# EasyEDA Pro project Macropad V1.epro

# Schematic keyboard
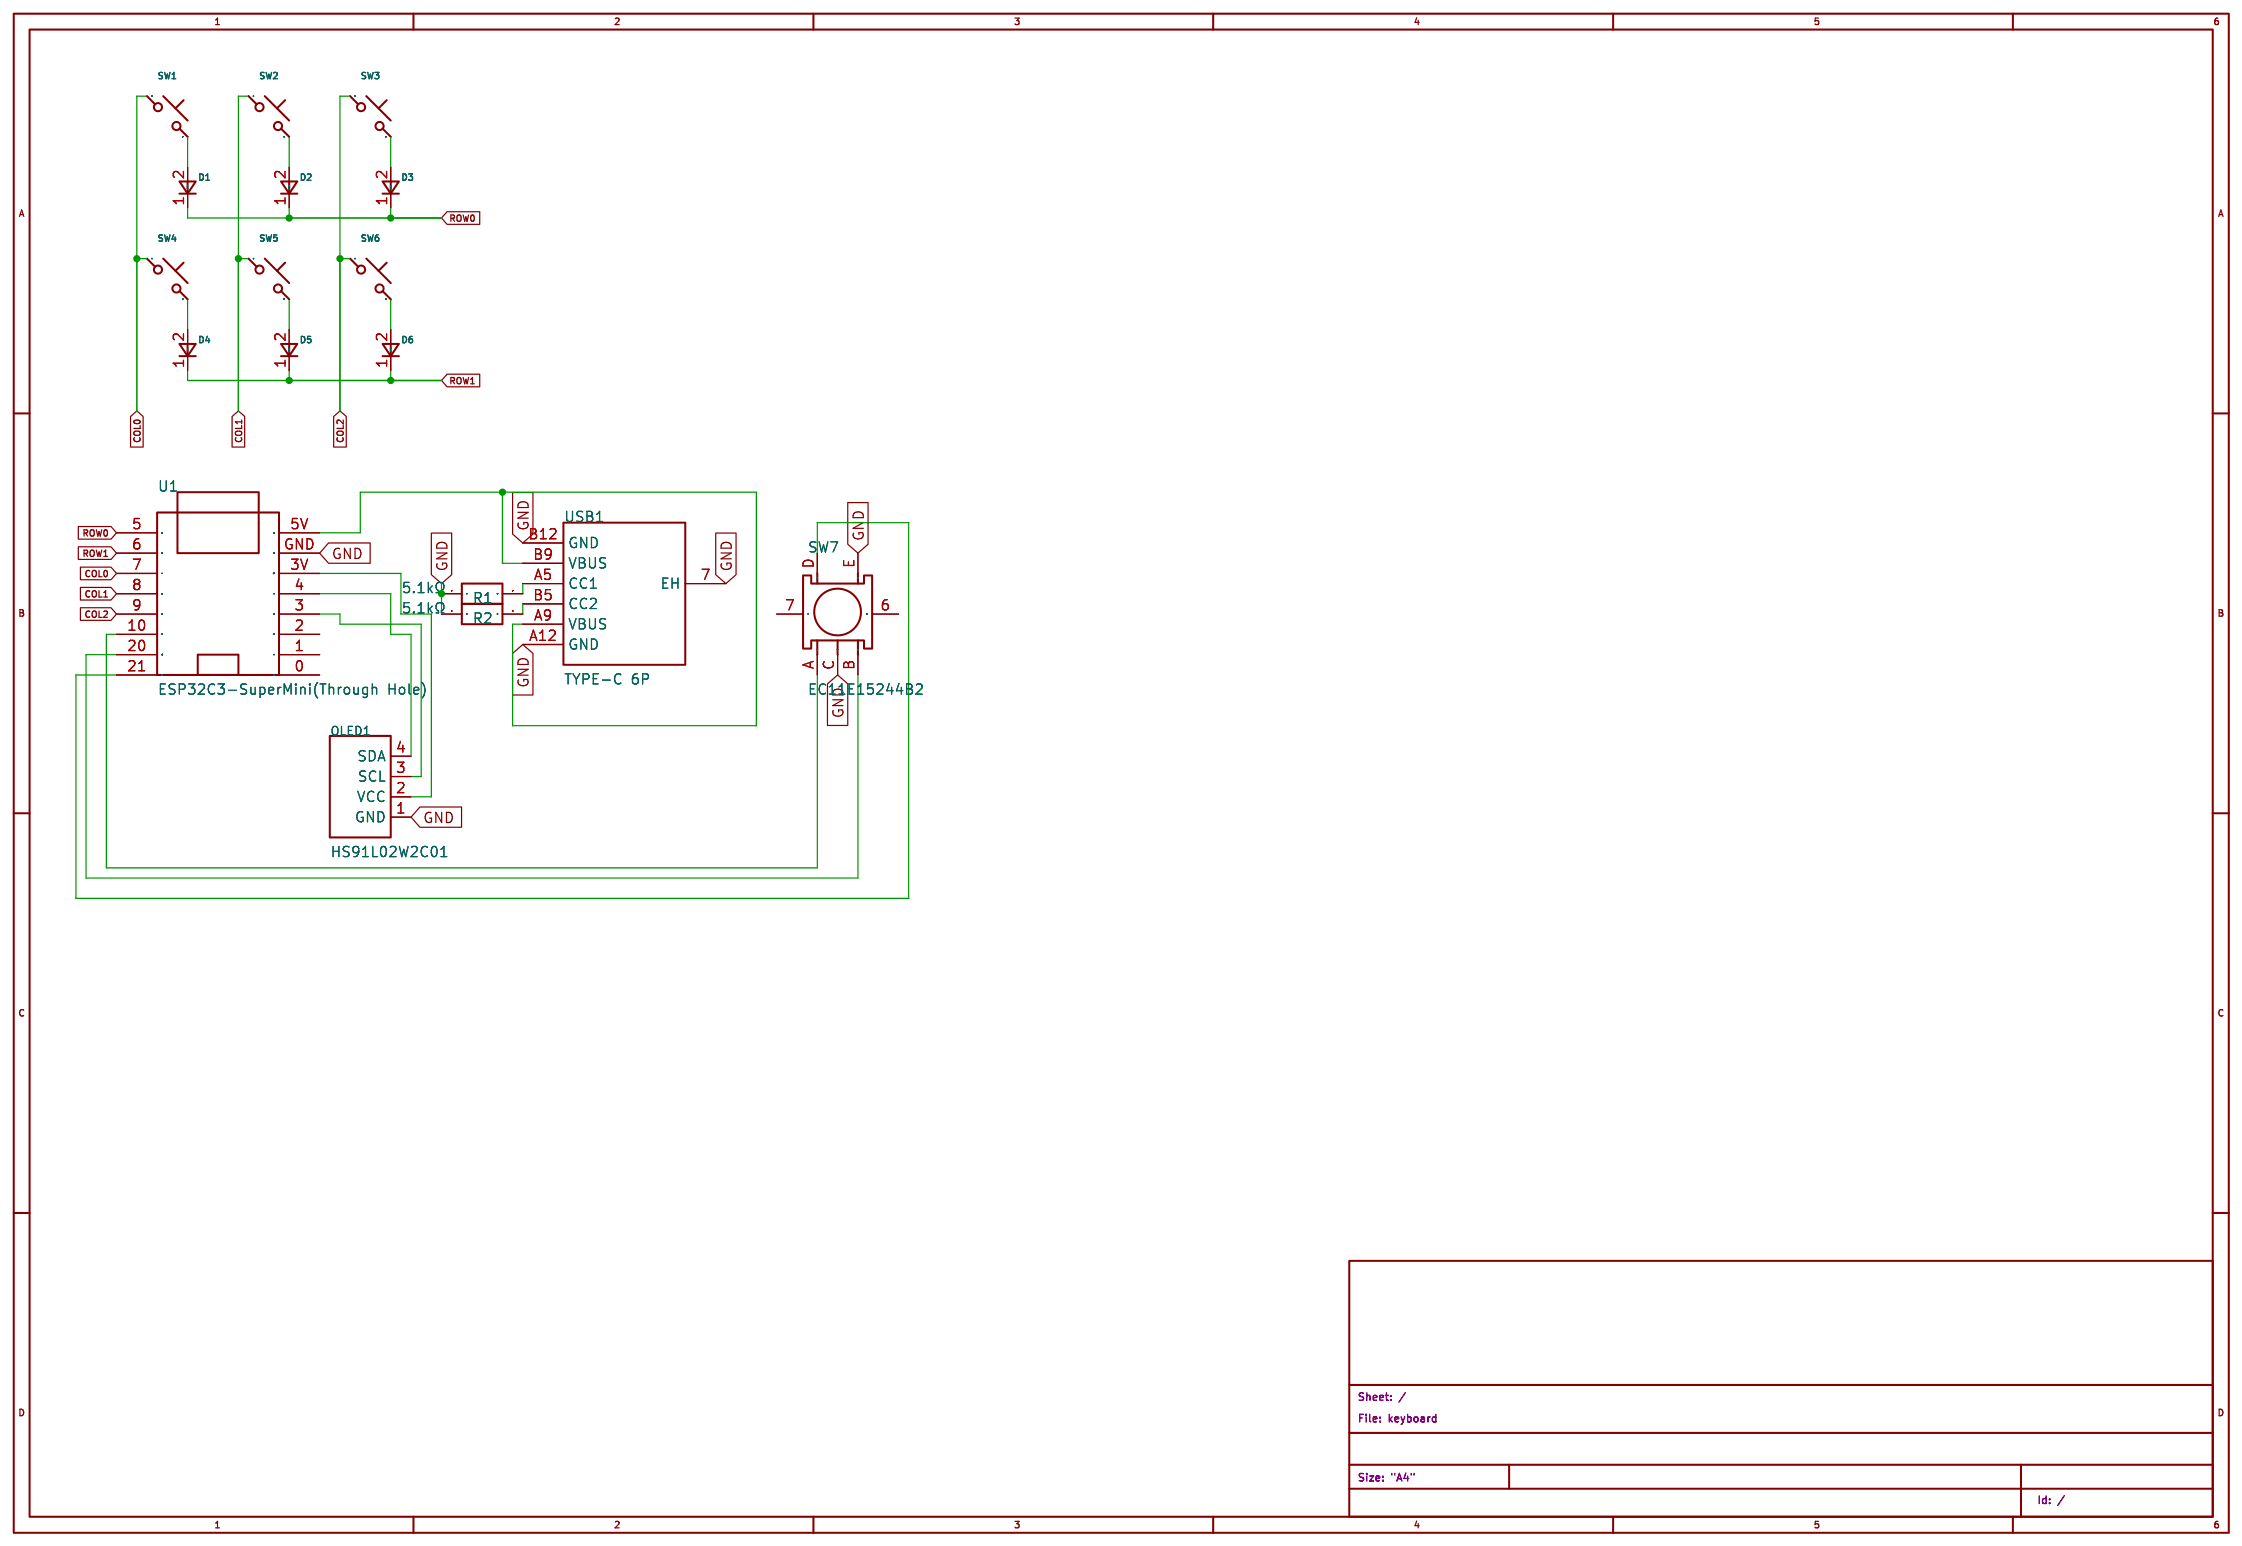
[diagram p0: schematic sheet]

## Parts
D1  D  [DO-35_BD2.2-L4.0-D0.50_1N4148]
D2  D  [DO-35_BD2.2-L4.0-D0.50_1N4148]
D3  D  [DO-35_BD2.2-L4.0-D0.50_1N4148]
D4  D  [DO-35_BD2.2-L4.0-D0.50_1N4148]
D5  D  [DO-35_BD2.2-L4.0-D0.50_1N4148]
D6  D  [DO-35_BD2.2-L4.0-D0.50_1N4148]
OLED1  HS91L02W2C01  [OLED-TH_L38.0-W12.0_HS91L02W2C01]
R1  5.1kΩ  [RES-TH_BD2.4-L6.3-P10.30-D0.6]
R2  5.1kΩ  [RES-TH_BD2.4-L6.3-P10.30-D0.6]
SW1  SW_Push  [Switch_Keyboard_Cherry_MX:SW_Cherry_MX_PCB]
SW2  SW_Push  [Switch_Keyboard_Cherry_MX:SW_Cherry_MX_PCB]
SW3  SW_Push  [Switch_Keyboard_Cherry_MX:SW_Cherry_MX_PCB]
SW4  SW_Push  [Switch_Keyboard_Cherry_MX:SW_Cherry_MX_PCB]
SW5  SW_Push  [Switch_Keyboard_Cherry_MX:SW_Cherry_MX_PCB]
SW6  SW_Push  [Switch_Keyboard_Cherry_MX:SW_Cherry_MX_PCB]
SW7  EC11E15244B2  [SW-TH_EC11XXXXXXXX]
U1  ESP32C3-SuperMini(Through Hole)  [ESP32C3-SUPERMINI(THROUGH HOLE)PCB]
USB1  TYPE-C 6P  [TYPE-C-SMD_TYPE-C-6P_1]

## Library data of the parts
D1-D6 = Device_D_Small: Sim.Pins: 1=K 2=A
OLED1 = HS91L02W2C01: Controller Type:SSD1306 chip Interface:I2C Size:0.91 Dot Pixels:128x32 Operating Temperature:- Operating Temperature:- Type of Drive:Passive (PMOLED) Display Range:22.384x5.584mm Display Color:White Luminance:150cd/m2 Function:- Quiescent Current:- Voltag; LCSC Part Name: 0.91寸OLED显示屏白光IIC; Supplier Part: C5248081; Manufacturer: HS(汉昇); JLCPCB Part Class: Extended Part; Datasheet: https://item.szlcsc.com/datasheet/HS91L02W2C01/5960632.html; Supplier: LCSC; Controller Type: SSD1306 chip; Interface: I2C; Size: 0.91; Dot Pixels: 128x32; Type of Drive: Passive (PMOLED); Display Range: 22.384x5.584mm; Display Color: White; Luminance: 150cd/m2; Voltage - Supply  For Logic: 1.65V~3.3V
R1 R2 = RD 1/4W 5K1 J T/B A1: Type:Carbon Resister Resistance:5.1kΩ Tolerance:±5% Tolerance:±5% Power(Watts):1/4W Temperature Coefficient:0ppm/℃~+500ppm/℃ Temperature Coefficient:0ppm/℃~+500ppm/℃; LCSC Part Name: 5.1kΩ ±5% 250mW 碳膜电阻; Supplier Part: C433710; Manufacturer: Tyohm(幸亚电阻); Supplier Footprint: 插件,D2.4xL6.5mm; JLCPCB Part Class: Extended Part; Datasheet: https://atta.szlcsc.com/upload/public/pdf/source/20191118/C433878_E7024DDDB7979B91D0A7809CE35A5E4E.pdf; Supplier: LCSC; Type: Carbon Resister; Tolerance: ±5%; Power(Watts): 1/4W; Temperature Coefficient: 0ppm/℃~+500ppm/℃
SW1-SW6 = Switch_SW_Push_45deg
SW7 = EC11E15244B2_C470754: Encoder Type:Incremental Number of Detents / Pulses (Incremental):30/15 Output Form:Two-phase output Mounting Type:Straight Current Rating (Max):10mA Rated Voltage (Max):5V Operating Temperature:-40℃~+85℃ Operating Temperature:-40℃~+85℃; LCSC Part Name: 11型金属轴型编码器; Supplier Part: C470754; Manufacturer: ALPSALPINE(阿尔卑斯阿尔派); Supplier Footprint: 插件; JLCPCB Part Class: Extended Part; Datasheet: https://item.szlcsc.com/datasheet/EC11E15244B2/476834.html; Supplier: LCSC; Encoder Type: Incremental; Number of Detents / Pulses (Incremental): 30/15; Output Form: Two-phase output; Mounting Type: Straight; Current Rating (Max): 10mA; Rated Voltage (Max): 5V; Operating Temperature: -40℃~+85℃
U1 = ESP32C3-SuperMini(Through Hole)
USB1 = TYPE-C 6P: Connector Type:Type-C Protocol Standard:- Gender:Female Mounting Type:Surface Mount, Right Angle Number of Contacts:6P Number of Ports:1 Current Rating-Power:3A Voltage Rating:5V Connect-Disconnect Life:3,000 Cycles Supplementary Features:- Center Height:; LCSC Part Name: Type-C 母 卧贴; Supplier Part: C456012; Manufacturer: SHOU HAN(首韩); Supplier Footprint: SMD; JLCPCB Part Class: Extended Part; Datasheet: https://item.szlcsc.com/datasheet/TYPE-C%25206P/458819.html; Supplier: LCSC; Connector Type: Type-C; Gender: Female; Mounting Type: Surface Mount, Right Angle; Number of Contacts: 6P; Number of Ports: 1; Current Rating-Power: 3A; Voltage Rating: 5V; Connect-Disconnect Life: 3,000 Cycles; Length: 6.8mm; Detection color: Black; Operating Temperature: -30℃~+85℃

## Nets
GND: OLED1.1(GND) R1.1 R2.1 SW7.C SW7.E U1.GND USB1.7(EH) USB1.A12(GND) USB1.B12(GND)
COL0: SW1.1 SW4.1 U1.7
COL1: SW2.1 SW5.1 U1.8
COL2: SW3.1 SW6.1 U1.9
ROW0: D1.1(K) D2.1(K) D3.1(K) U1.5
ROW1: D4.1(K) D5.1(K) D6.1(K) U1.6
$2N2: D1.2(A) SW1.2
$2N5: D2.2(A) SW2.2
$2N7: D3.2(A) SW3.2
$2N8: D4.2(A) SW4.2
$2N10: D5.2(A) SW5.2
$2N11: D6.2(A) SW6.2
$2N19: R2.2 USB1.B5(CC2)
$2N20: R1.2 USB1.A5(CC1)
$2N27: U1.5V USB1.A9(VBUS) USB1.B9(VBUS)
$2N30: OLED1.4(SDA) U1.4
$2N31: OLED1.3(SCL) U1.3
$2N32: OLED1.2(VCC) U1.3V(3.3V)
$2N35: SW7.A U1.10
$2N36: SW7.B U1.20
$2N37: SW7.D U1.21

Not connected (* = marked no-connect by the designer): SW7 6 7; U1 0 1 2

# Board PCB1
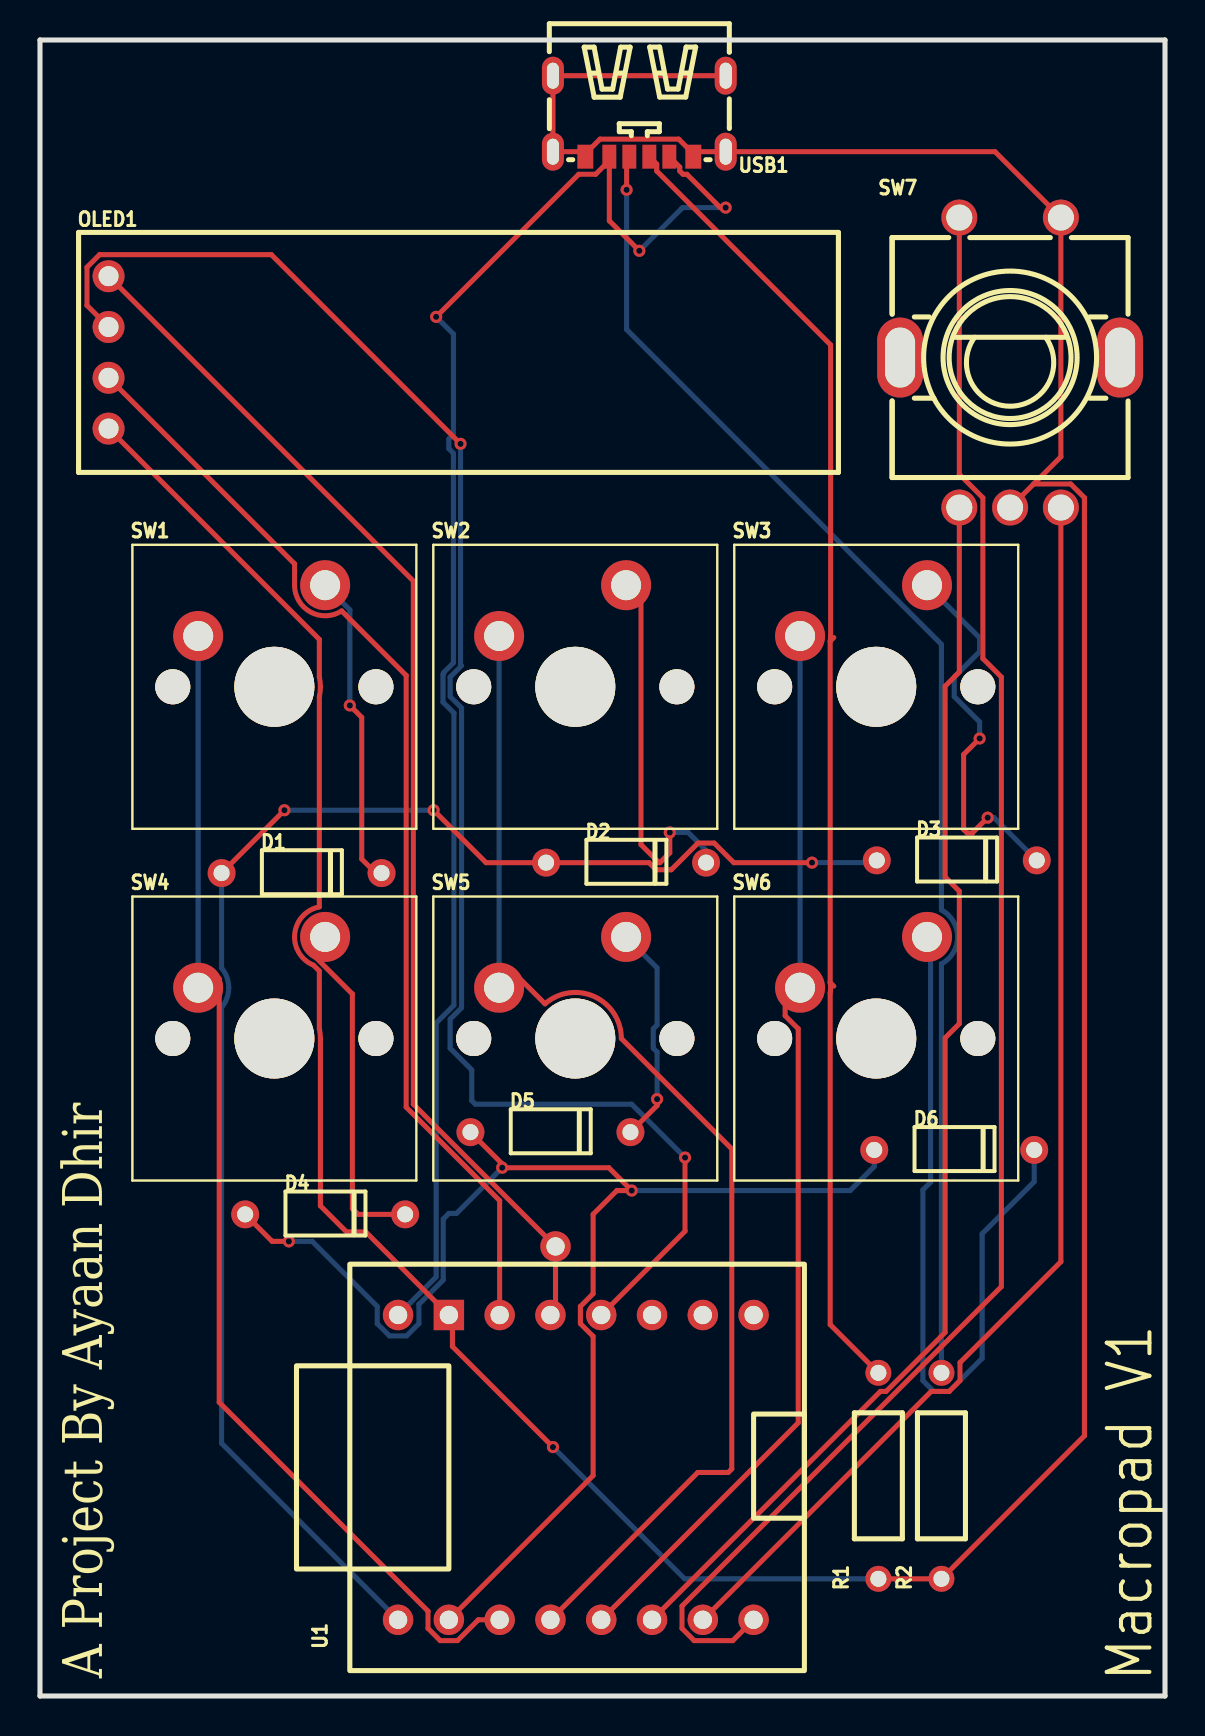
[diagram p1: board, top side]
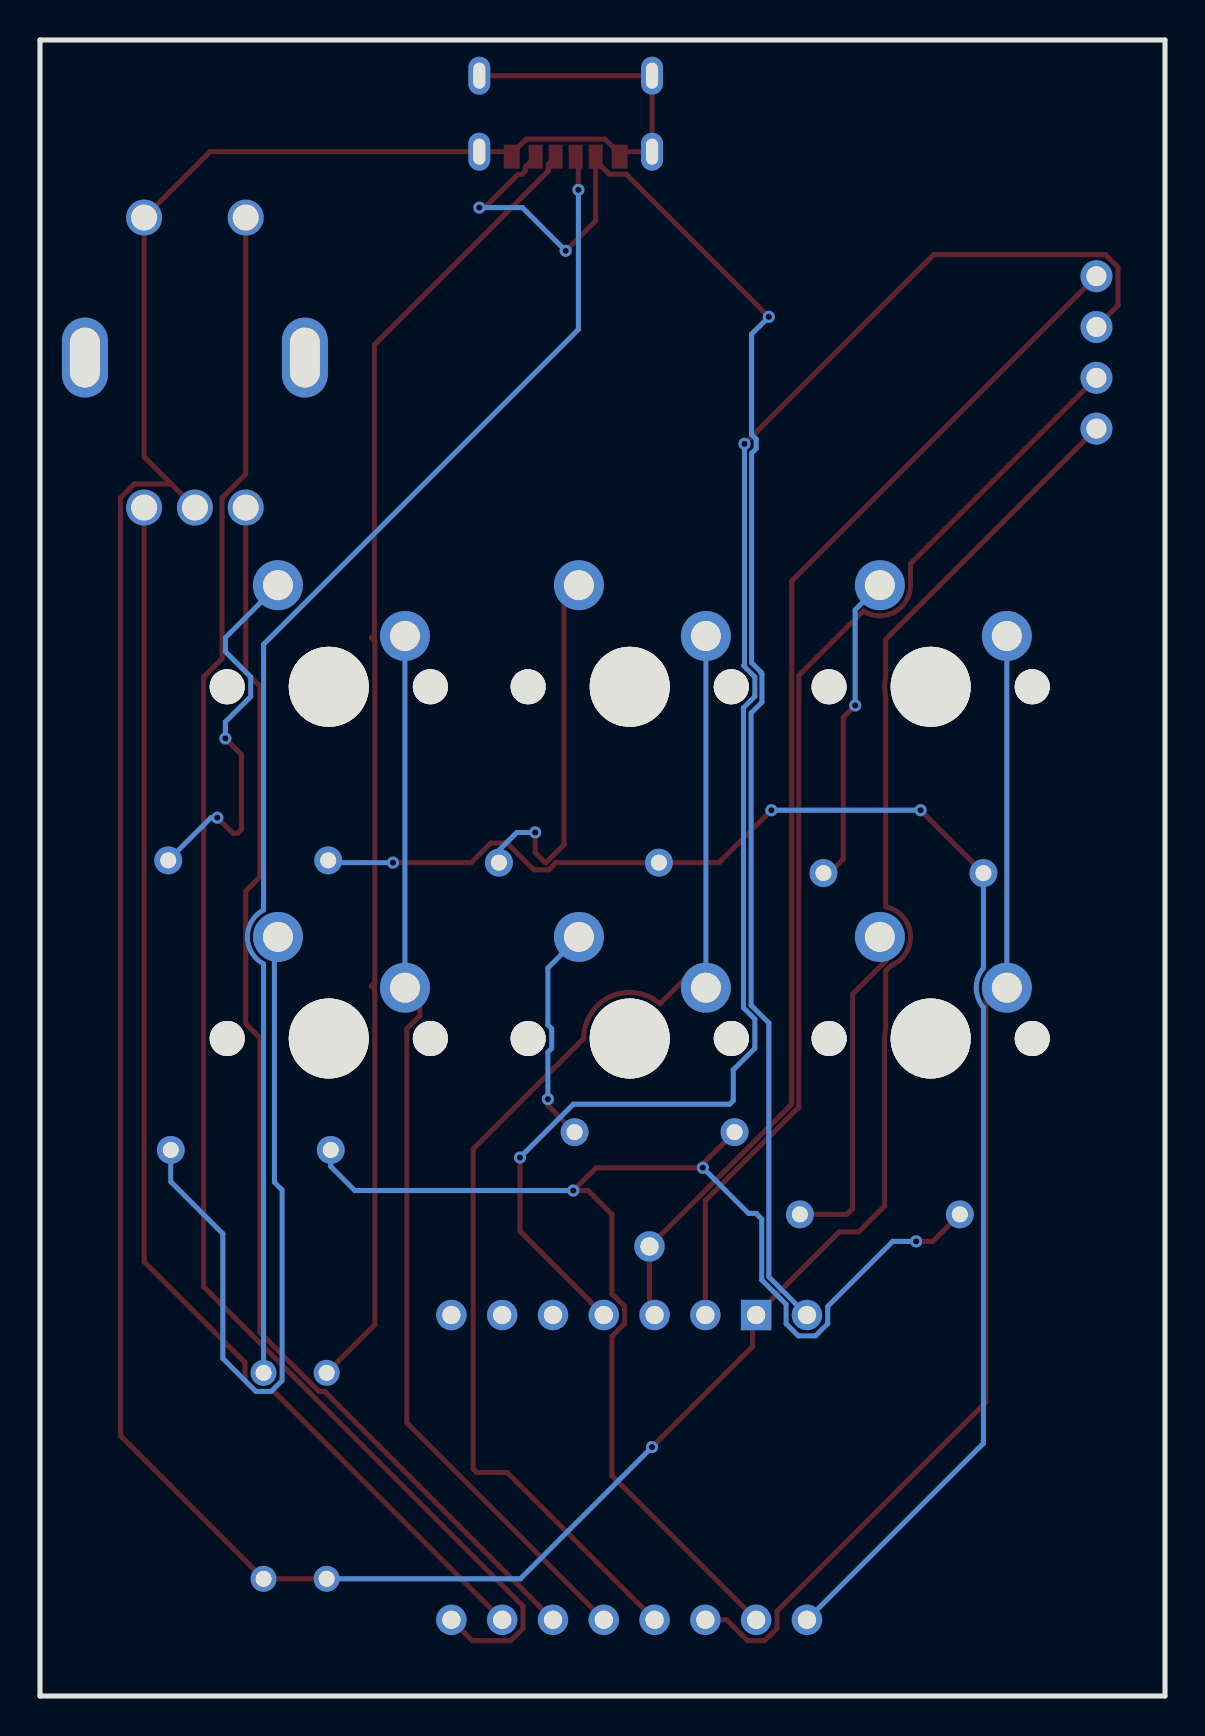
[diagram p2: board, bottom side, seen from below]

Outline 56.26 x 82.8 mm; copper layers: Top Layer, Bottom Layer. Coordinates in mm from the lower left corner of the outline.
Outline path: 0,82.8 56.26,82.8 56.26,0 0,0 0,82.8
Stack: Top Layer 0.035mm / Dielectric1 1.51mm FR4 er 4.5 / Bottom Layer 0.035mm

## Design rules (mm)
spacing copperThickness1oz (default): track to track 0.102, other pairs 0.152 to 0.3
spacing copperThickness2oz: track to track 0.203, other pairs 0.152 to 0.3
track width copperThickness1oz (default): min 0.127, default 0.254, max 2.54
track width copperThickness2oz: min 0.203, default 0.254, max 2.54
differential pair differentialPair (default): width min 0.127, default 0.254, max 2.54; gap min 0.152, default 0.152

## Placement (name value [footprint] x y rotation side)
D1  D  [DO-35_BD2.2-L4.0-D0.50_1N4148]  13.08 41.15 0 top
D2  D  [DO-35_BD2.2-L4.0-D0.50_1N4148]  29.31 41.67 0 top
D3  D  [DO-35_BD2.2-L4.0-D0.50_1N4148]  45.85 41.78 0 top
D4  D  [DO-35_BD2.2-L4.0-D0.50_1N4148]  14.26 24.08 0 top
D5  D  [DO-35_BD2.2-L4.0-D0.50_1N4148]  25.53 28.19 0 top
D6  D  [DO-35_BD2.2-L4.0-D0.50_1N4148]  45.72 27.3 0 top
NOREF  -  [Pad_e46]  25.78 22.48 180 top
OLED1  HS91L02W2C01  [OLED-TH_L38.0-W12.0_HS91L02W2C01]  3.43 67.18 0 top
R1  5.1kΩ  [RES-TH_BD2.4-L6.3-P10.30-D0.6]  41.93 11.01 90 top
R2  5.1kΩ  [RES-TH_BD2.4-L6.3-P10.30-D0.6]  45.08 11.01 90 top
SW1  SW_Push  [Switch_Keyboard_Cherry_MX:SW_Cherry_MX_PCB]  11.72 50.46 0 top
SW2  SW_Push  [Switch_Keyboard_Cherry_MX:SW_Cherry_MX_PCB]  26.77 50.46 0 top
SW3  SW_Push  [Switch_Keyboard_Cherry_MX:SW_Cherry_MX_PCB]  41.82 50.46 0 top
SW4  SW_Push  [Switch_Keyboard_Cherry_MX:SW_Cherry_MX_PCB]  11.72 32.88 0 top
SW5  SW_Push  [Switch_Keyboard_Cherry_MX:SW_Cherry_MX_PCB]  26.77 32.88 0 top
SW6  SW_Push  [Switch_Keyboard_Cherry_MX:SW_Cherry_MX_PCB]  41.82 32.88 0 top
SW7  EC11E15244B2  [SW-TH_EC11XXXXXXXX]  48.51 66.67 0 top
U1  ESP32C3-SuperMini(Through Hole)  [ESP32C3-SUPERMINI(THROUGH HOLE)PCB]  26.8 11.43 90 top
USB1  TYPE-C 6P  [TYPE-C-SMD_TYPE-C-6P_1]  29.97 78.99 180 top

## Footprints (pads in the part's own frame, mm; a bottom-side part is the same pattern mirrored in y, then rotated)
DO-35_BD2.2-L4.0-D0.50_1N4148
  round 1.4 hole 0.8: 1(-4,0) 2(4,0)
ESP32C3-SUPERMINI(THROUGH HOLE)PCB
  round 1.524 hole 0.914: 0(7.62,-8.89) 1(7.62,-6.35) 2(7.62,-3.81) 3(7.62,-1.27) 3V(7.62,3.81) 4(7.62,1.27) 5(-7.62,8.89) 5V(7.62,8.89) 6(-7.62,6.35) 7(-7.62,3.81) 8(-7.62,1.27) 9(-7.62,-1.27) 10(-7.62,-3.81) 20(-7.62,-6.35) 21(-7.62,-8.89)
  rect 1.524x1.524 hole 0.914: GND(7.62,6.35)
OLED-TH_L38.0-W12.0_HS91L02W2C01
  round 1.6 hole 1: 1(0,-3.81) 2(0,-1.27) 3(0,1.27) 4(0,3.81)
Pad_e46
  round 1.524 hole 0.914: 1(0,0)
RES-TH_BD2.4-L6.3-P10.30-D0.6
  round 1.3 hole 0.8: 1(-5.15,0) 2(5.15,0)
SW-TH_EC11XXXXXXXX
  oval 2.3x4 hole 1.5x3: 6(5.5,0.25) 7(-5.5,0.25)
  round 1.8 hole 1.3: A(-2.54,-7.25) B(2.54,-7.25) C(0,-7.25) D(-2.54,7.25) E(2.54,7.25)
Switch_Keyboard_Cherry_MX:SW_Cherry_MX_PCB
  round 1.75 hole 1.75: (-5.08,0) (5.08,0)
  round 1.55 smd: (-3.81,2.54) (2.54,5.08)
  round 4 hole 4: (0,0)
  round 2.5 hole 1.5: 1(-3.81,2.54) 2(2.54,5.08)
TYPE-C-SMD_TYPE-C-6P_1
  oval 1.1x1.9 hole 0.6x1.3: 7(-4.32,1.775) 7(-4.32,-2.025) 7(4.32,1.775) 7(4.32,-2.025)
  rect 0.7x1.2 smd: A5(-0.5,2.025) A9(1.5,2.025) B5(0.5,2.025) B9(-1.5,2.025)
  rect 0.8x1.2 smd: A12(2.7,2.025) B12(-2.7,2.025)

## Nets
As in the schematic, except:
$2N30: NOREF.1 OLED1.4 U1.4

Pads without a net: SW7 6 7; U1 0 1 2

## Via types
v1: diameter 0.61, hole 0.305, Top Layer to Bottom Layer, 19 vias

## Routing (per net, layer and track width the routed paths; a pad name or vN(x,y) marks a point on that pad's centre or on a via; arc(x,y) is an arc through that point)
GND: length 199.1
  Top Layer w0.254: 49.69,60.6 51.05,61.96 SW7.E 47.76,77.22 32.57,77.22 31.94,77.85 28.01,77.85 27.38,77.22 USB1.7 USB1.7 34.29,81.02 ; 49.69,60.6 51.54,60.6 52.23,59.91 52.23,13.01 R2.1 R1.1 ; 49.69,60.6 SW7.C ; OLED1.1 13.97,52.83 13.97,50.95 arc(14.01,50.71) 14.02,50.46 arc(14.01,50.22) 13.97,49.97 13.97,39.46 arc(13.08,38.93) 12.73,37.96 arc(12.99,37.1) 13.68,36.54 13.97,36.25 13.97,33.37 arc(14.01,33.12) 14.02,32.88 14.02,24.51 15.33,23.2 16.29,23.2 U1.GND 20.63,18.87 20.63,17.47 v1(25.65,12.45)
  Bottom Layer w0.254: R1.1 32.24,5.86 v1(25.65,12.45)
COL0: length 59.1
  Top Layer w0.254: 8.66,36.16 8.96,35.85 8.96,14.68 19.41,4.24 19.41,3.38 20.02,2.77 20.88,2.77 21.92,3.81 22.99,3.81
  Bottom Layer w0.254: SW1.1 SW4.1
COL1: length 61.1
  Top Layer w0.254: 25.53,3.81 32.89,11.18 34.42,11.18 34.6,11.36 34.6,27.35 29.07,32.88 arc(27.72,34.97) 25.26,34.61 23.71,36.16
  Bottom Layer w0.254: SW2.1 SW5.1
COL2: length 52.8
  Top Layer w0.254: 28.07,3.81 37.92,13.66 37.92,33.36 37.26,34.02 37.26,34.67
  Bottom Layer w0.254: SW3.1 SW6.1
ROW0: length 77.5
  Top Layer w0.254: v1(19.69,44.29) 22.31,41.67 D2.1 30.46,41.67 30.81,41.31 31.57,41.31 32.9,42.65 33.72,42.65 34.69,41.67 v1(38.61,41.67) ; D1.1 v1(12.22,44.29)
  Bottom Layer w0.254: D1.1 9.08,36.4 arc(9.35,35.94) 9.44,35.42 arc(9.35,34.89) 9.08,34.43 9.08,12.64 17.91,3.81 ; v1(38.61,41.67) 41.73,41.67 D3.1 ; v1(19.69,44.29) v1(12.22,44.29)
ROW1: length 70.8
  Top Layer w0.254: D4.1 11.61,22.73 v1(12.45,22.73) ; 20.45,3.81 27.66,11.02 27.66,17.98 27.03,18.62 27.03,19.48 27.66,20.11 27.66,24.08 28.85,25.27 v1(29.59,25.27) 28.45,26.42 v1(23.11,26.42) 23.11,26.61 D5.1
  Bottom Layer w0.254: v1(23.11,26.42) 20.83,24.13 20.45,24.13 20.17,23.85 20.17,20.81 18.95,19.59 18.95,18.62 18.34,18.01 17.48,18.01 16.87,18.62 16.87,19.48 13.61,22.73 v1(12.45,22.73) ; D6.1 41.72,26.48 40.51,25.27 v1(29.59,25.27)
$2N2: length 15.7
  Top Layer w0.254: D1.2 16.79,41.15 16.09,41.85 16.09,48.93 v1(15.49,49.53)
  Bottom Layer w0.254: v1(15.49,49.53) 15.49,54.31 v1(14.26,55.54)
$2N5: length 18.2
  Top Layer w0.254: v1(31.5,43.18) 31.5,42.16 31,41.67 30.96,41.67 30.06,42.57 30.06,54.8
  Bottom Layer w0.254: D2.2 33.49,41.85 33.49,42.1 32.41,43.18 v1(31.5,43.18)
$2N7: length 19.6
  Top Layer w0.254: v1(46.99,47.88) 46.19,47.08 46.19,43.33 46.37,43.15 46.62,43.15 v1(47.39,43.92)
  Bottom Layer w0.254: SW3.2 46.99,52.91 46.99,52.22 45.72,50.95 45.72,49.97 46.99,48.71 v1(46.99,47.88) ; v1(47.39,43.92) 47.71,43.92 D3.2
$2N8: length 16.5
  Top Layer w0.254: 13.51,37.21 15.62,35.1 15.62,24.37 15.91,24.08 D4.2
$2N10: length 11.1
  Top Layer w0.254: D5.2 30.86,29.53 v1(30.86,29.84)
  Bottom Layer w0.254: SW5.2 30.86,36.4 30.86,33.55 30.67,33.36 30.67,32.39 30.86,32.2 v1(30.86,29.84)
$2N11: length 37.8
  Bottom Layer w0.254: SW6.2 44.54,37.78 44.54,25.69 44.15,25.3 44.15,15.77 44.7,15.23 45.47,15.23 47.12,16.88 47.12,23.11 49.72,25.72 D6.2
$2N19: length 68
  Top Layer w0.254: USB1.B5 29.34,76.83 v1(29.34,75.31)
  Bottom Layer w0.254: v1(29.34,75.31) 29.34,68.33 45.08,52.58 45.08,39.3 arc(45.67,38.74) 45.89,37.96 arc(45.67,37.17) 45.08,36.61 R2.2
$2N20: length 66.1
  Top Layer w0.254: 39.52,35.67 39.52,52.75 ; 39.52,35.67 39.7,35.49 ; 39.52,35.67 arc(39.53,35.54) 39.54,35.42 arc(39.53,35.29) 39.52,35.16 39.52,18.57 R1.2 ; 39.52,52.75 39.7,52.93 ; 39.52,52.75 arc(39.53,52.87) 39.54,53 39.54,67.56 30.84,76.25 30.84,76.6 USB1.A5
$2N27: length 78.5
  Top Layer w0.254: USB1.B9 31.99,76.45 31.99,76.25 32.16,76.09 32.35,76.09 34.02,74.42 v1(34.29,74.42) ; 28.47,76.77 USB1.A9 ; 28.47,76.77 28.47,73.76 v1(29.97,72.26) ; 28.47,76.77 27.79,76.09 26.94,76.09 v1(19.81,68.96)
  Bottom Layer w0.254: v1(29.97,72.26) 32.13,74.42 v1(34.29,74.42) ; v1(19.81,68.96) 20.67,68.1 20.67,63.08 20.45,62.85 20.45,62.37 20.67,62.14 20.67,51.66 20.19,51.18 20.19,51.14 20.16,51.1 20.16,49.69 20.7,49.15 20.7,34.54 19.81,33.65 19.81,20.95 U1.5V
$2N30: length 61.3
  Top Layer w0.254: U1.4 25.78,19.3 NOREF.1 18.67,29.59 18.67,55.75 OLED1.4
$2N31: length 81.7
  Top Layer w0.254: U1.3 32.26,23.24 v1(32.26,26.92) ; OLED1.3 2.35,69.53 2.35,71.44 2.98,72.07 11.57,72.07 v1(21.03,62.61)
  Bottom Layer w0.254: v1(32.26,26.92) 29.59,29.59 21.77,29.59 21.59,29.77 21.59,31.31 20.51,32.39 20.51,33.85 21.08,34.42 21.08,49.4 20.51,49.97 20.51,50.95 21.08,51.52 ; 21.03,51.52 v1(21.03,62.61)
$2N32: length 56
  Top Layer w0.254: OLED1.2 12.73,56.61 12.73,55.54 arc(13.53,54.2) 15.09,54.26 18.31,51.03 18.31,29.44 22.99,24.77 U1.3V
$2N35: length 62.7
  Top Layer w0.254: 30.61,3.81 42.03,15.23 42.31,15.23 45.27,18.18 45.27,32.91 45.97,33.62 45.97,40.25 45.27,40.95 45.27,50.49 45.97,51.2 SW7.A
$2N36: length 63.6
  Top Layer w0.254: 33.15,3.81 44.57,15.23 45.47,15.23 46.01,15.77 46.01,16.67 51.05,21.72 SW7.B
$2N37: length 82.3
  Top Layer w0.254: SW7.D 45.97,61.09 47.15,59.91 47.15,51.88 48.08,50.95 48.08,20.47 32.11,4.5 32.11,3.38 32.72,2.77 34.65,2.77 35.69,3.81

## Text on the board
Top Silkscreen Layer: Macropad V1 | A Project By Ayaan Dhir
